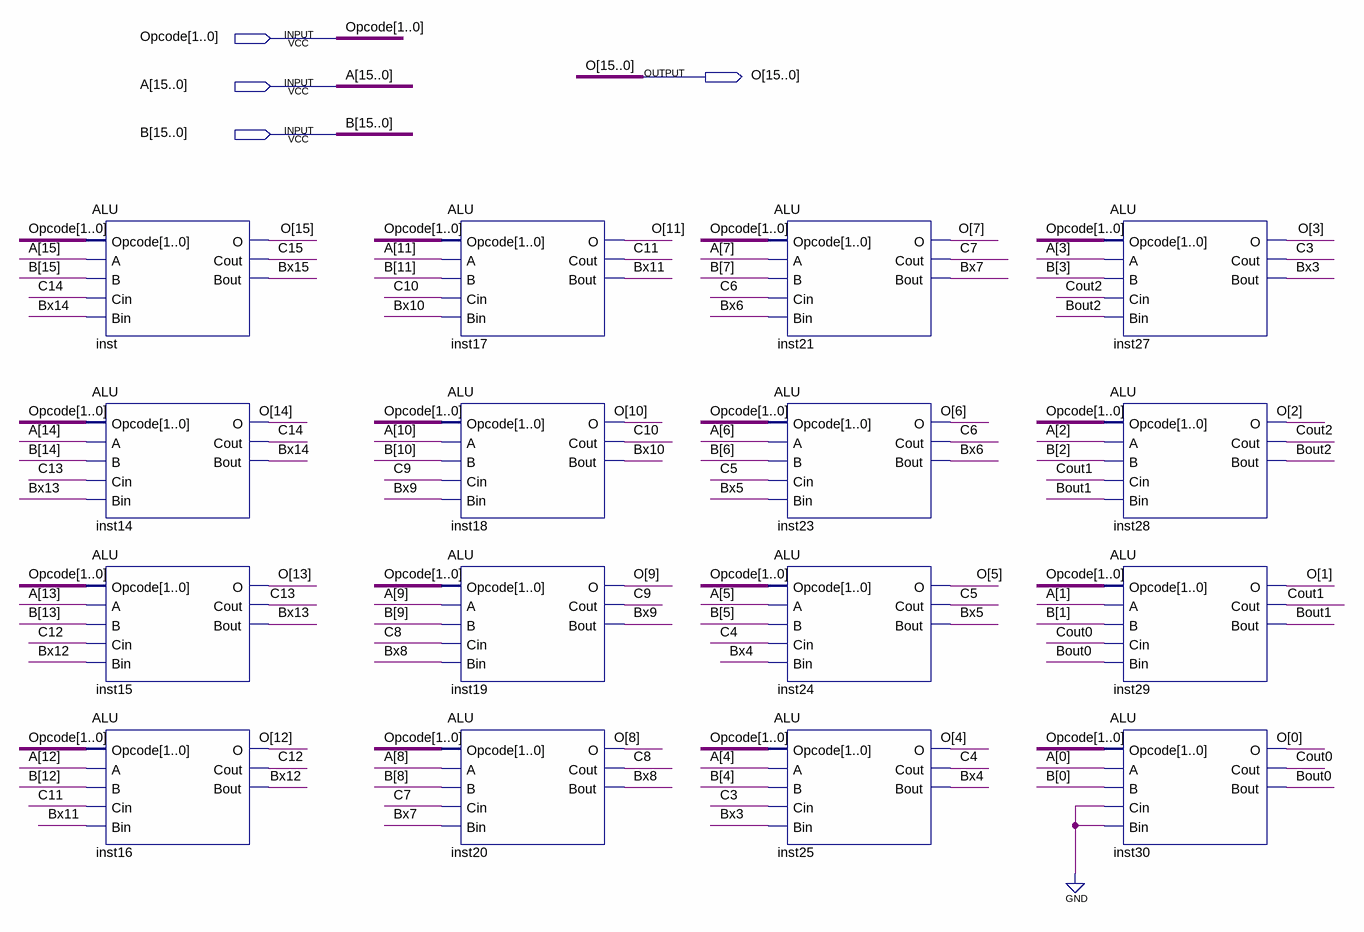
[diagram p0: schematic sheet]
// Quartus schematic ALU_16.bdf as structural Verilog: 16 symbols, 4 pins
module ALU_16 (
  input  [1:0] Opcode,
  input  [15:0] A,
  input  [15:0] B,
  output [15:0] O
);

  wire Bout0, Bout1, Bout2, Bx3, Bx4, Bx5, Bx6, Bx7, Bx8, Bx9, Bx10, Bx11, Bx12, Bx13, Bx14, Bx15, C3, C4,
       C5, C6, C7, C8, C9, C10, C11, C12, C13, C14, C15, Cout0, Cout1, Cout2;

  ALU inst (.Opcode(Opcode), .A(A[15]), .B(B[15]), .Cin(C14), .Bin(Bx14), .O(O[15]), .Cout(C15), .Bout(Bx15));
  ALU inst14 (.Opcode(Opcode), .A(A[14]), .B(B[14]), .Cin(C13), .Bin(Bx13), .O(O[14]), .Cout(C14), .Bout(Bx14));
  ALU inst15 (.Opcode(Opcode), .A(A[13]), .B(B[13]), .Cin(C12), .Bin(Bx12), .O(O[13]), .Cout(C13), .Bout(Bx13));
  ALU inst16 (.Opcode(Opcode), .A(A[12]), .B(B[12]), .Cin(C11), .Bin(Bx11), .O(O[12]), .Cout(C12), .Bout(Bx12));
  ALU inst17 (.Opcode(Opcode), .A(A[11]), .B(B[11]), .Cin(C10), .Bin(Bx10), .O(O[11]), .Cout(C11), .Bout(Bx11));
  ALU inst18 (.Opcode(Opcode), .A(A[10]), .B(B[10]), .Cin(C9), .Bin(Bx9), .O(O[10]), .Cout(C10), .Bout(Bx10));
  ALU inst19 (.Opcode(Opcode), .A(A[9]), .B(B[9]), .Cin(C8), .Bin(Bx8), .O(O[9]), .Cout(C9), .Bout(Bx9));
  ALU inst20 (.Opcode(Opcode), .A(A[8]), .B(B[8]), .Cin(C7), .Bin(Bx7), .O(O[8]), .Cout(C8), .Bout(Bx8));
  ALU inst21 (.Opcode(Opcode), .A(A[7]), .B(B[7]), .Cin(C6), .Bin(Bx6), .O(O[7]), .Cout(C7), .Bout(Bx7));
  ALU inst23 (.Opcode(Opcode), .A(A[6]), .B(B[6]), .Cin(C5), .Bin(Bx5), .O(O[6]), .Cout(C6), .Bout(Bx6));
  ALU inst24 (.Opcode(Opcode), .A(A[5]), .B(B[5]), .Cin(C4), .Bin(Bx4), .O(O[5]), .Cout(C5), .Bout(Bx5));
  ALU inst25 (.Opcode(Opcode), .A(A[4]), .B(B[4]), .Cin(C3), .Bin(Bx3), .O(O[4]), .Cout(C4), .Bout(Bx4));
  ALU inst27 (.Opcode(Opcode), .A(A[3]), .B(B[3]), .Cin(Cout2), .Bin(Bout2), .O(O[3]), .Cout(C3), .Bout(Bx3));
  ALU inst28 (.Opcode(Opcode), .A(A[2]), .B(B[2]), .Cin(Cout1), .Bin(Bout1), .O(O[2]), .Cout(Cout2), .Bout(Bout2));
  ALU inst29 (.Opcode(Opcode), .A(A[1]), .B(B[1]), .Cin(Cout0), .Bin(Bout0), .O(O[1]), .Cout(Cout1), .Bout(Bout1));
  ALU inst30 (.Opcode(Opcode), .A(A[0]), .B(B[0]), .Cin(1'b0), .Bin(1'b0), .O(O[0]), .Cout(Cout0), .Bout(Bout0));
endmodule
